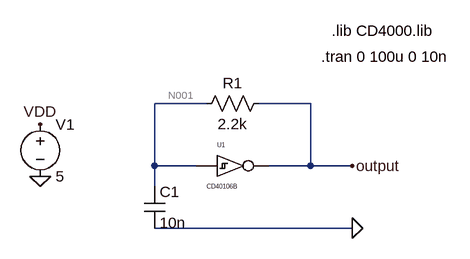
[diagram p0: schematic Design3_2.2k.asc]
Design3_2.2k.asc, the LTspice schematic file:
Version 4
SHEET 1 880 680
WIRE 176 80 96 80
WIRE 336 80 256 80
WIRE 96 176 96 80
WIRE 160 176 96 176
WIRE 336 176 336 80
WIRE 336 176 272 176
WIRE 400 176 336 176
WIRE 96 208 96 176
WIRE 400 272 96 272
FLAG -80 112 VDD
FLAG -80 192 0
FLAG 400 272 0
FLAG 400 176 output
SYMBOL CD4000\\CD40106B 208 128 R0
SYMATTR InstName U1
SYMBOL cap 80 208 R0
SYMATTR InstName C1
SYMATTR Value 10n
SYMBOL res 272 64 R90
WINDOW 0 0 56 VBottom 2
WINDOW 3 32 56 VTop 2
SYMATTR InstName R1
SYMATTR Value 2.2k
SYMBOL voltage -80 96 R0
WINDOW 123 0 0 Left 0
WINDOW 39 0 0 Left 0
SYMATTR InstName V1
SYMATTR Value 5
TEXT 368 -32 Left 2 !.lib CD4000.lib
TEXT 352 8 Left 2 !.tran 0 100u 0 10n

The netlist it stands for:
* Design3_2.2k.asc
XU1 N001 output VDD 0 CD40106B VDD=5  SPEED=1.0  TRIPDT=5e-9  ; pins A Y
C1 N001 0 10n
R1 output N001 2.2k
V1 VDD 0 5
.lib CD4000.lib
.tran 0 100u 0 10n
.backanno
.end

* Results of the author's LTspice run, read from the files saved beside the schematic
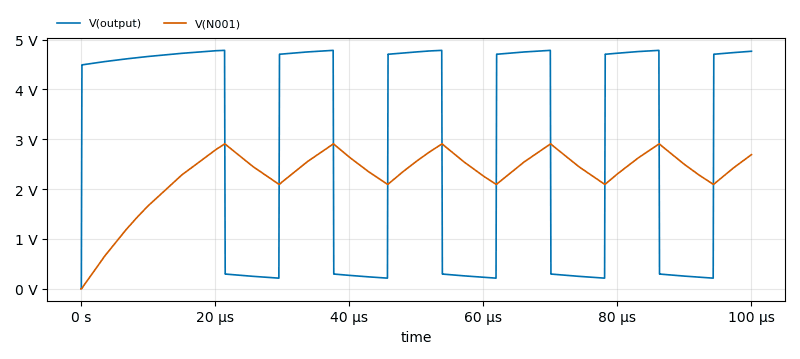
[diagram p1: Transient Analysis of Design3_2.2k.asc, plotted from the saved traces]
* Transient Analysis, 1 run:
*   V(output): min 0 V, max 4.782 V, average 2.904 V, rms 3.633 V, last 4.764 V
*   V(N001): min 0 V, max 2.907 V, average 2.31 V, rms 2.382 V, last 2.692 V